# Altium schematic sheet Top.SchDoc: SmartTrack
size A4; Engineer: ZMP; Organization: Unival Logistics; Address1: 550 S Hill St.; Address2: Suite 1607; Address3: Los Angeles, CA 90013; Revision: A; SheetNumber: 1; SheetTotal: 6
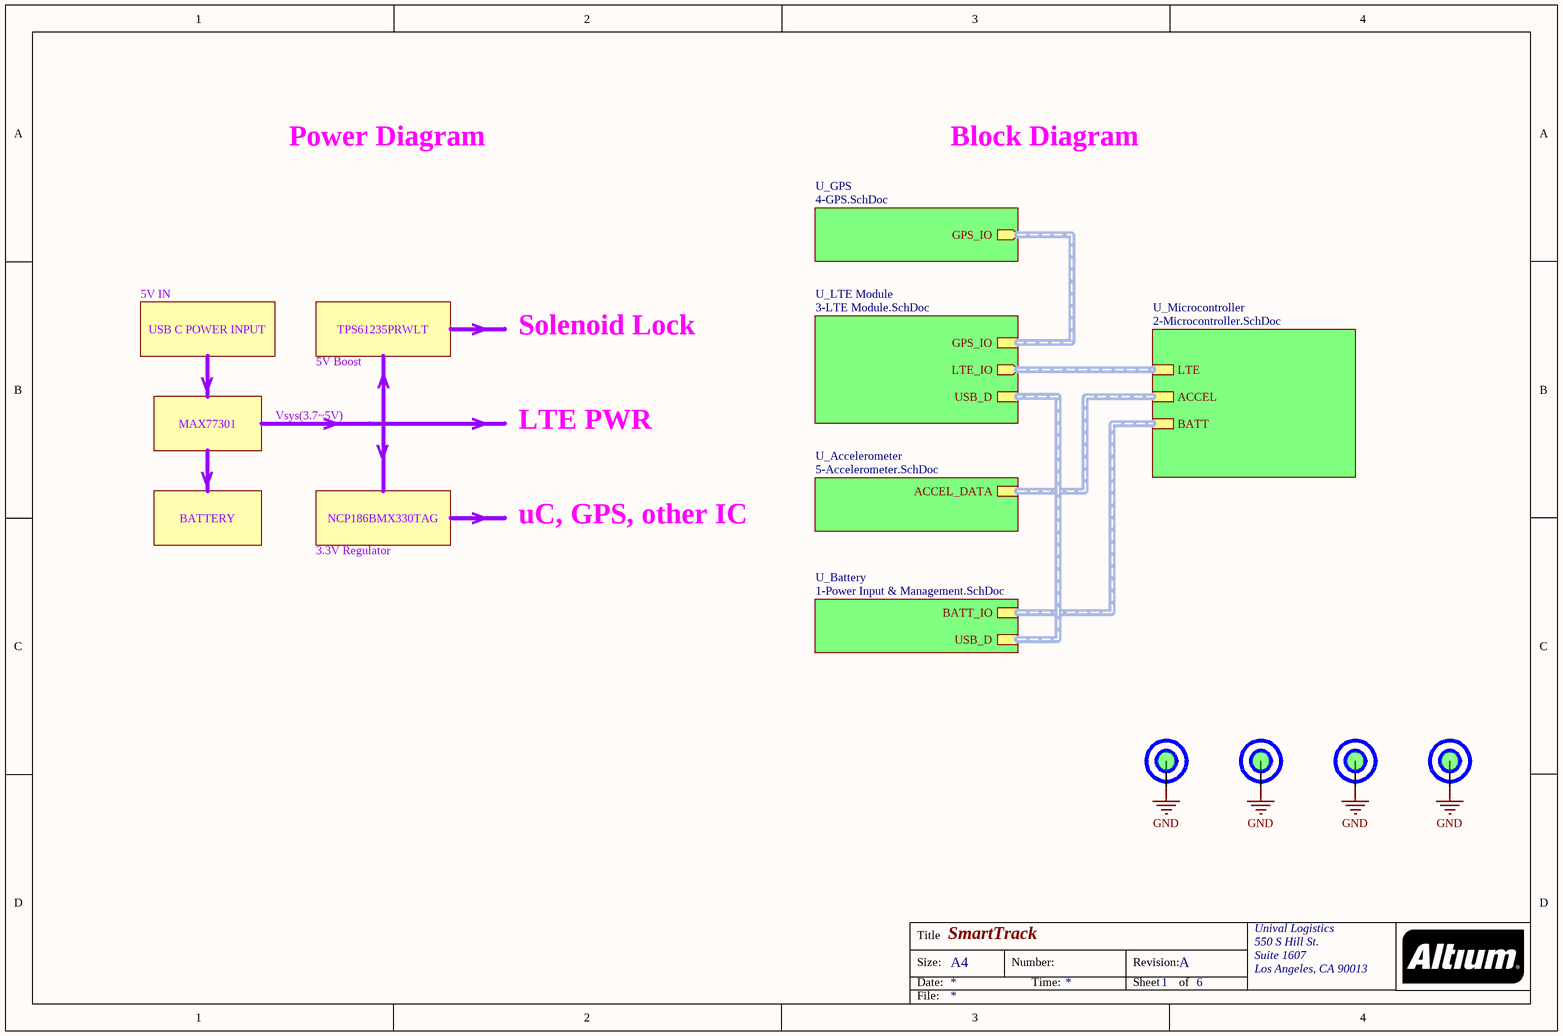
[diagram p0: Top.SchDoc]

## Parts
MNT1  MOUNTING HOLE  [MNT620-275N]  (value not drawn)
MNT2  MOUNTING HOLE  [MNT620-275N]  (value not drawn)
MNT3  MOUNTING HOLE  [MNT620-275N]  (value not drawn)
MNT4  MOUNTING HOLE  [MNT620-275N]  (value not drawn)

## Sub-sheets
U_Accelerometer = 5-Accelerometer.SchDoc: ACCEL_DATA (harness ACCEL)
U_Battery = 1-Power Input & Management.SchDoc: BATT_IO (harness I2C), USB_D (harness USB)
U_GPS = 4-GPS.SchDoc: GPS_IO (out, harness GPS)
U_LTE Module = 3-LTE Module.SchDoc: LTE_IO (out, harness LTE), GPS_IO (harness GPS), USB_D (harness USB)
U_Microcontroller = 2-Microcontroller.SchDoc: ACCEL (harness ACCEL), LTE (harness LTE), BATT (harness I2C)

## Nets
GND: MNT1.1(GND) MNT2.1(GND) MNT3.1(GND) MNT4.1(GND)

## Buses and harness runs
harness sheet U_Accelerometer/ACCEL_DATA = sheet U_Microcontroller/ACCEL
harness sheet U_Battery/BATT_IO = sheet U_Microcontroller/BATT
harness sheet U_Battery/USB_D = sheet U_LTE Module/USB_D
harness sheet U_GPS/GPS_IO = sheet U_LTE Module/GPS_IO
harness sheet U_LTE Module/LTE_IO = sheet U_Microcontroller/LTE

## Notes on the sheet
- Power Diagram
- Block Diagram
- 5V IN
- USB C POWER INPUT
- 5V Boost
- TPS61235PRWLT
- V
- Solenoid Lock
- MAX77301
- Vsys(3.7~5V)
- LTE PWR
- BATTERY
- NCP186BMX330TAG
- 3.3V Regulator
- uC, GPS, other IC
- Title
- Size:
- Date:
- A4
- Number:
- Time:
- Revision:
- Sheet
- of
- File:

## Library data of the parts
MNT1-MNT4 = MNT_1: Part #: NA; Notes: PCB; Emcraft #: NA